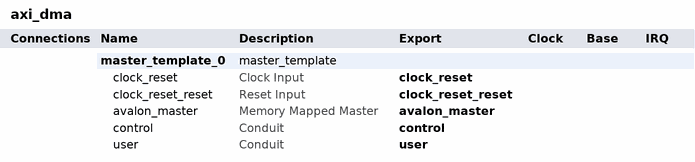
[diagram p0: system contents]
# Platform Designer (Qsys) system axi_dma, Cyclone V 5CSEBA2U19I7
# Parameters at their usual value, and those the tool derives, are not listed.
package require qsys
create_system axi_dma
set_project_property DEVICE_FAMILY {Cyclone V}
set_project_property DEVICE 5CSEBA2U19I7

add_instance master_template_0 master_template 1.0
set_instance_property master_template_0 AUTO_EXPORT true
set_instance_parameter_value master_template_0 ADDRESS_WIDTH 32
set_instance_parameter_value master_template_0 BURST_CAPABLE 1
set_instance_parameter_value master_template_0 DATA_WIDTH 32
set_instance_parameter_value master_template_0 FIFO_DEPTH 256
set_instance_parameter_value master_template_0 MASTER_DIRECTION 1
set_instance_parameter_value master_template_0 MAXIMUM_BURST_COUNT 32
set_instance_parameter_value master_template_0 MEMORY_BASED_FIFO 1

# exported interfaces
add_interface avalon_master avalon master
set_interface_property avalon_master EXPORT_OF master_template_0.avalon_master
add_interface clock_reset clock sink
set_interface_property clock_reset EXPORT_OF master_template_0.clock_reset
add_interface clock_reset_reset reset sink
set_interface_property clock_reset_reset EXPORT_OF master_template_0.clock_reset_reset
add_interface control conduit end
set_interface_property control EXPORT_OF master_template_0.control
add_interface user conduit end
set_interface_property user EXPORT_OF master_template_0.user

set_interconnect_requirement {$system} qsys_mm.clockCrossingAdapter HANDSHAKE
set_interconnect_requirement {$system} qsys_mm.enableEccProtection FALSE
set_interconnect_requirement {$system} qsys_mm.insertDefaultSlave FALSE
set_interconnect_requirement {$system} qsys_mm.maxAdditionalLatency 1

save_system axi_dma.qsys
